# Altium schematic sheet TOP LEVEL.SchDoc: BLOCK DIAGRAM
size 558 x 431 mm; Engineer: Awad Shibli; SheetNumber: 1; SheetTotal: 6
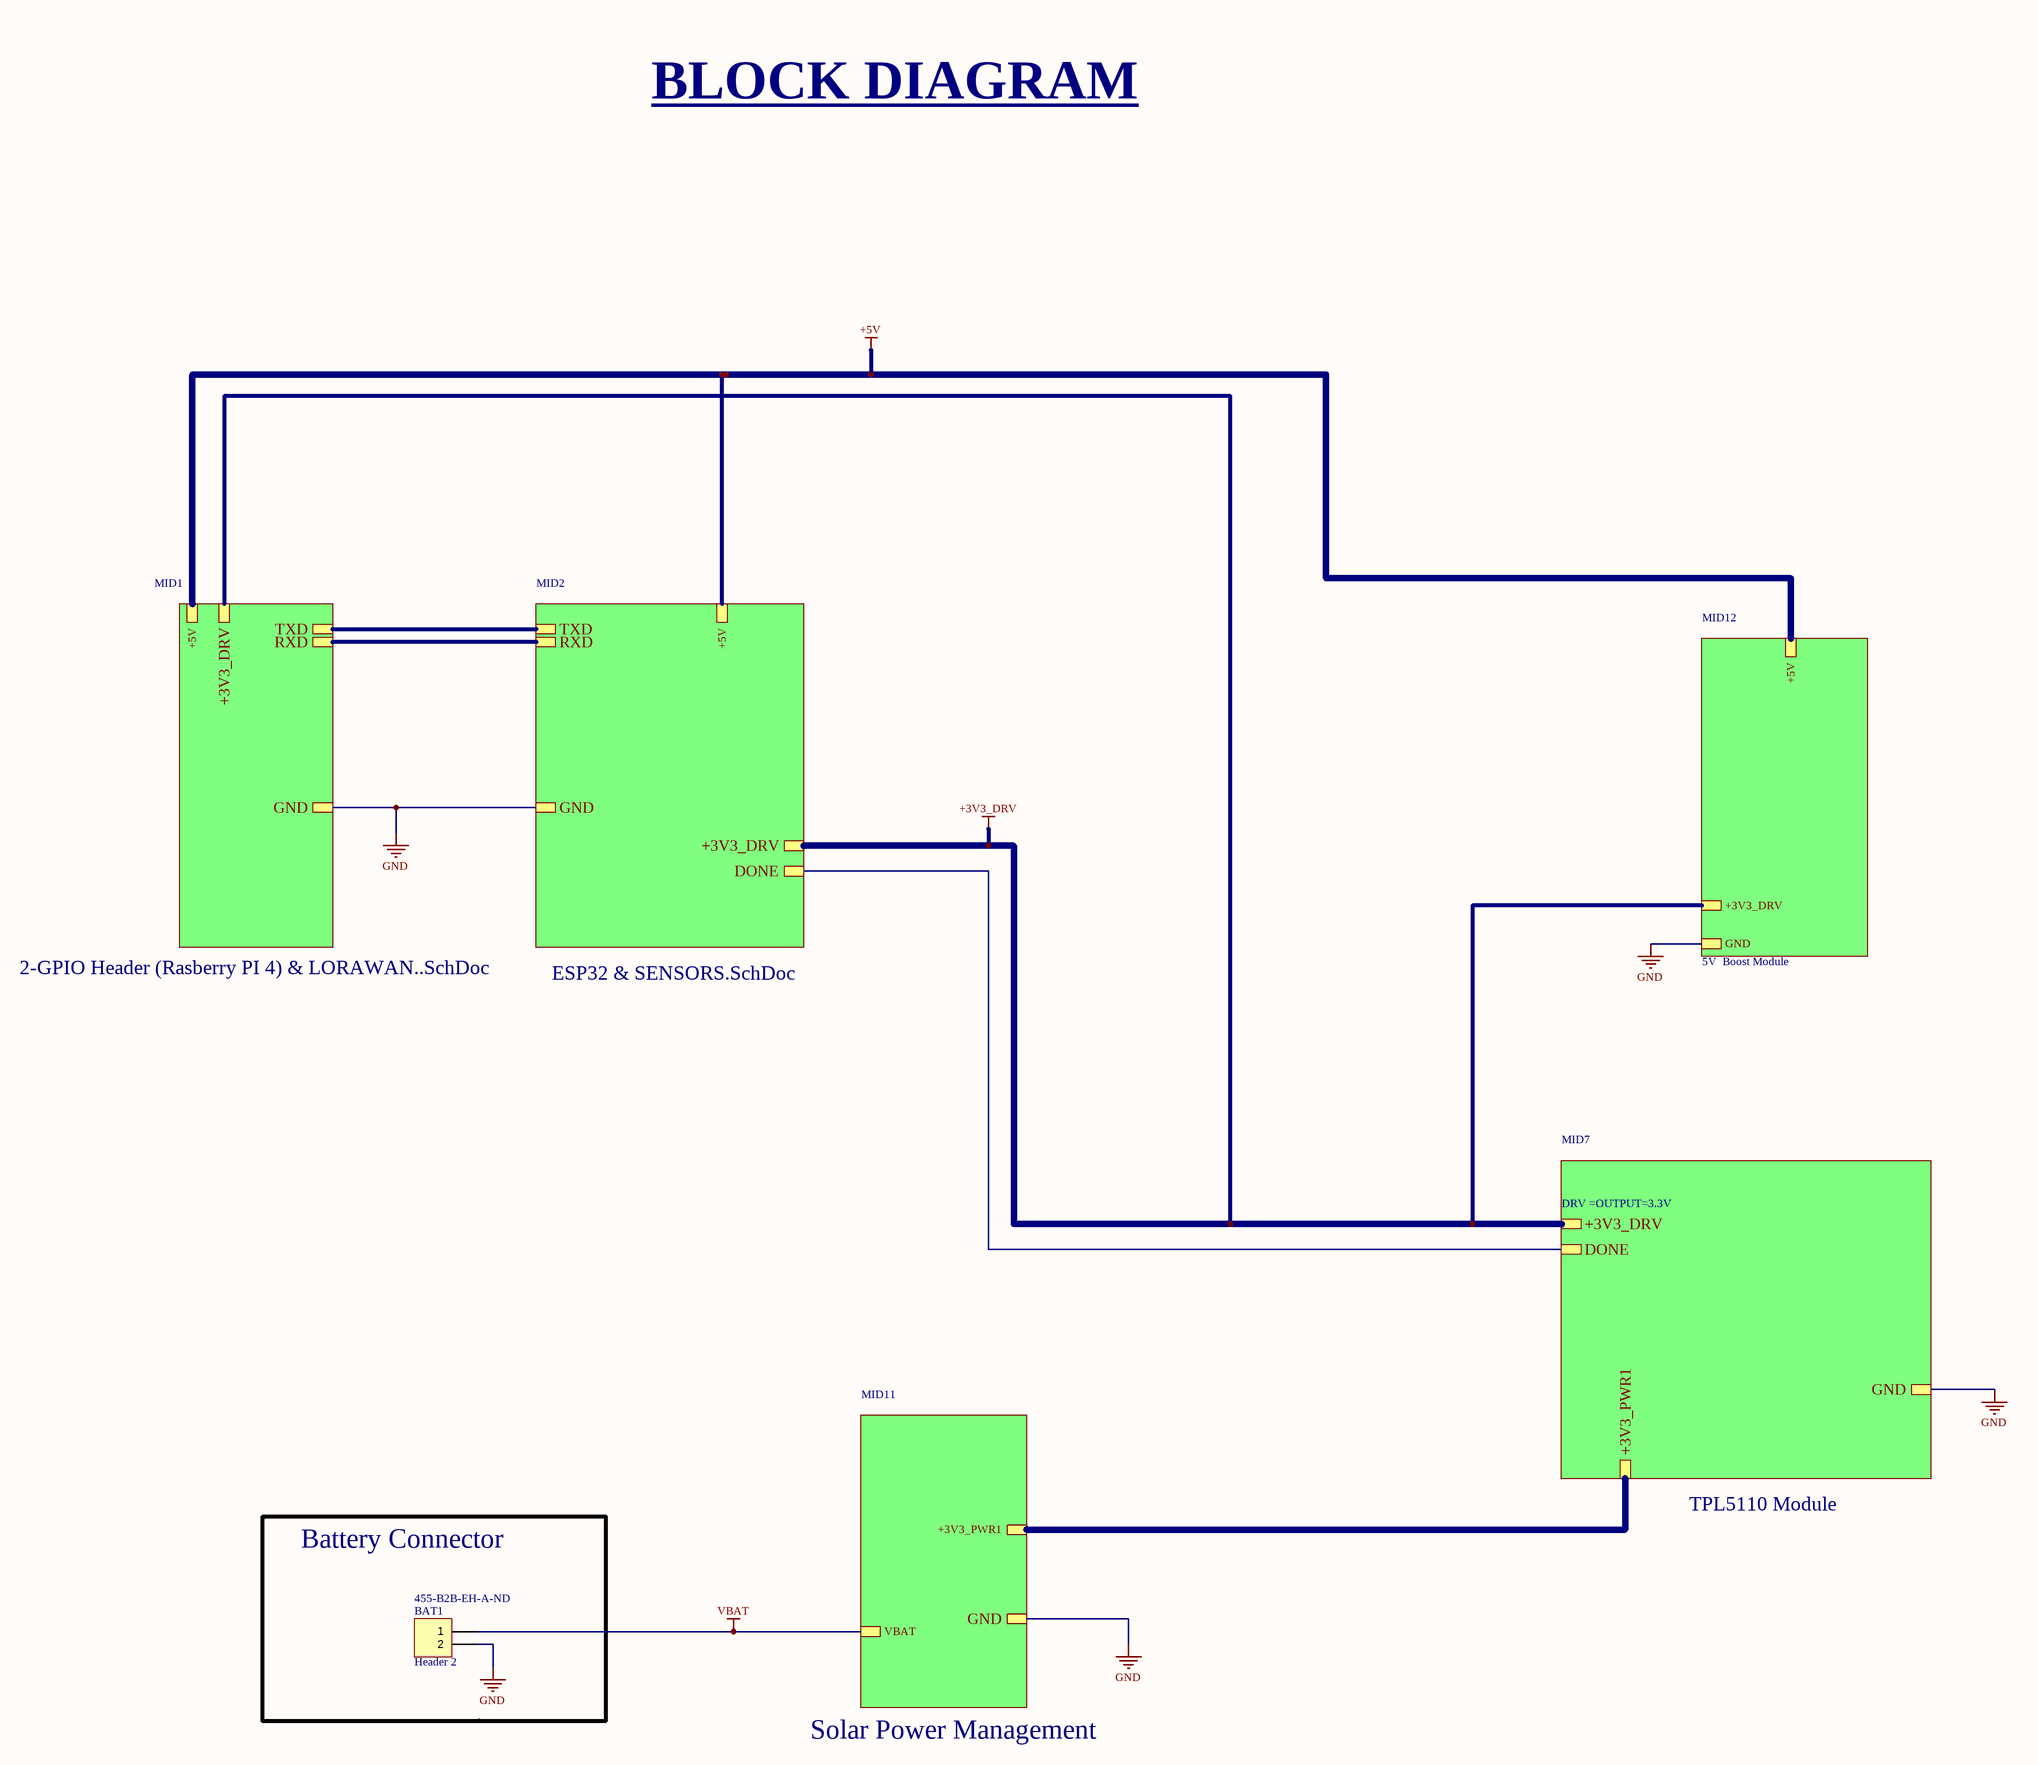
[diagram p0: TOP LEVEL.SchDoc]

## Parts
BAT1  Header 2  Supplier Part Number 1: 455-B2B-EH-A-ND  [HDR1X2]

## Blocks framed on the sheet
Battery Connector: BAT1

## Sub-sheets
MID1 = 2-GPIO Header (Rasberry PI 4) & LORAWAN..SchDoc: TXD, RXD, +5V, GND, +3V3_DRV
MID2 = ESP32 & SENSORS.SchDoc: +3V3_DRV, DONE, RXD, TXD, GND, +5V
MID7 = TPL5110 Module: +3V3_DRV, DONE, +3V3_PWR1, GND
MID11 = Solar Power Management: VBAT, +3V3_PWR1, GND
MID12 = 5V  Boost Module: +5V, GND, +3V3_DRV

## Nets
+3V3_DRV: sheet MID1/+3V3_DRV, sheet MID2/+3V3_DRV, sheet MID7/+3V3_DRV, sheet MID12/+3V3_DRV
+5V: sheet MID1/+5V, sheet MID2/+5V, sheet MID12/+5V
GND: BAT1.2 ; sheet MID1/GND, sheet MID2/GND, sheet MID7/GND, sheet MID11/GND, sheet MID12/GND
VBAT: BAT1.1 ; sheet MID11/VBAT
(unnamed): sheet MID1/TXD, sheet MID2/TXD
(unnamed): sheet MID1/RXD, sheet MID2/RXD
(unnamed): sheet MID2/DONE, sheet MID7/DONE
(unnamed): sheet MID7/+3V3_PWR1, sheet MID11/+3V3_PWR1

## Notes on the sheet
- BLOCK DIAGRAM
- DRV =OUTPUT=3.3V
- DWG. NO.
- REV.
- SHT.
- REVISION
- DESCRIPTION
- DATE
- APPROVED
- THIS DOCUMENT AND THE DATA DISCLOSED HEREIN OR HEREWITH IS THE PROPERTY OF ALTIUM LIMITED AND MAY BE FREELY DISTRIBUTED IN WHOLE. NO RIGHTS ARE RESERVED OR EXPRESS OR IMPLIED WARANTEE GIVEN.
- ENG:
- DSN:
- APPROVALS
- PROJECT
- DOCUMENT REVISION:
- DESIGN ITEM:
- CHK:
- BOM:
- REFERENCE DOCUMENTS
- PROJECT REVISION:
- TITLE
- FAB DWG:
- PCB DWG:
- ASSY DWG:
- SCALE:
- SIZE
- C
- CAGE CODE
- FILE NAME
- DWG NO.
- SHEET
- OF
- REV

## Library data of the parts
BAT1 = Header 2: CONN HEADER EH TOP 2POS 2.5MM; Manufacturer: JST; Manufacturer Part Number: B2B-EH-A; Number of Positions: 2; Gender: Male; Pitch: 0.098inch; LatestRevisionDate: 17-Jul-2002; LatestRevisionNote: Re-released for DXP Platform.; Publisher: Altium Limited; Supplier 1: Digikey; RoHS: Yes; Category: Connectors; Stock 1: 251874; Pricing 1: 1=0.13, 10=0.099, 100=0.0756, 500=0.06274, 1000=0.05803, 5000=0.04865, 10000=0.04521 (USD); Mount: Through Hole; Color: Natural; Contact Plating: Tin,Lead; Housing Color: White; Contact Material: Brass; Housing Material: Nylon; Fastening Type: Detent; Packaging: Bulk; Package Quantity: 1000; Number of Rows: 1; Termination: Press-Fit; Number of Contacts: 2; Series: EH; Contact Type: Male Pin; Contact Mating Length: 0.13inch; Lead Free: Contains Lead; ComponentLink1URL: https://media.digikey.com/pdf/Data%20Sheets/JST%20PDFs/EH%20Series.pdf?src-supplier=Digikey; ComponentLink1Description: https://media.digikey.com/pdf/Data%20Sheets/JST%20PDFs/EH%20Series.pdf?src-supplier=Digikey